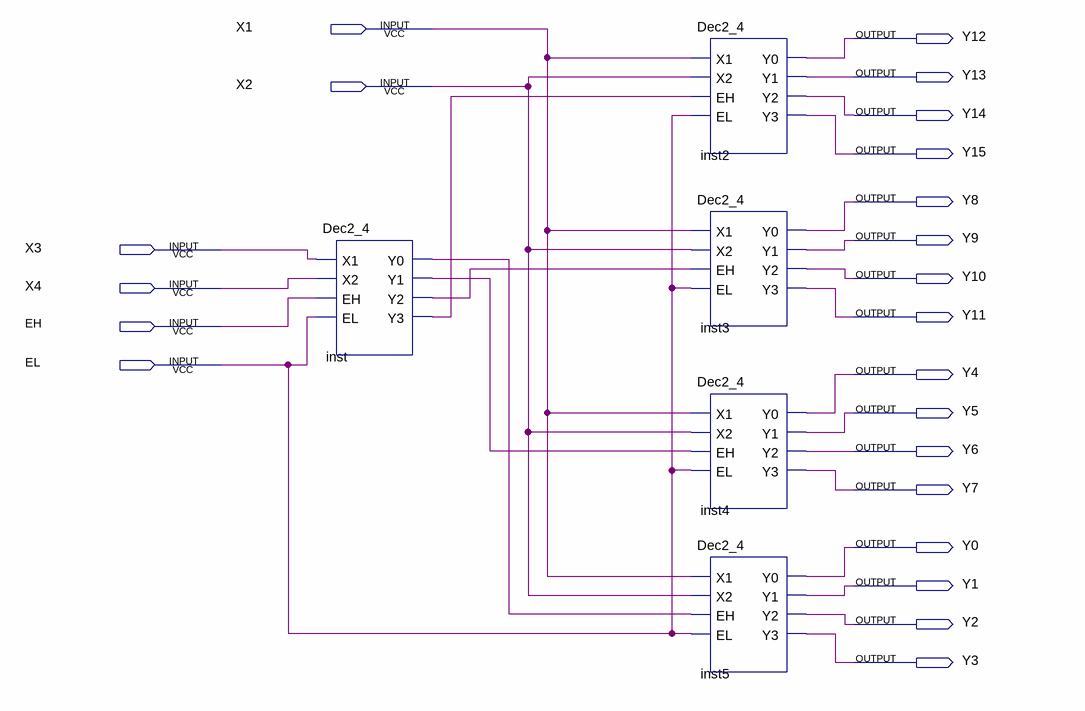
[diagram p0: schematic sheet]
// Quartus schematic Dec4_16.bdf as structural Verilog: 5 symbols, 22 pins
module Dec4_16 (
  input  X1,
  input  X2,
  input  X3,
  input  X4,
  input  EH,
  input  EL,
  output Y12,
  output Y13,
  output Y14,
  output Y15,
  output Y8,
  output Y9,
  output Y10,
  output Y11,
  output Y4,
  output Y5,
  output Y6,
  output Y7,
  output Y0,
  output Y1,
  output Y2,
  output Y3
);

  wire inst_y0, inst_y1, inst_y2, inst_y3;

  Dec2_4 inst (.X1(X3), .X2(X4), .EH(EH), .EL(EL), .Y0(inst_y0), .Y1(inst_y1), .Y2(inst_y2), .Y3(inst_y3));
  Dec2_4 inst2 (.X1(X1), .X2(X2), .EH(inst_y3), .EL(EL), .Y0(Y12), .Y1(Y13), .Y2(Y14), .Y3(Y15));
  Dec2_4 inst3 (.X1(X1), .X2(X2), .EH(inst_y2), .EL(EL), .Y0(Y8), .Y1(Y9), .Y2(Y10), .Y3(Y11));
  Dec2_4 inst4 (.X1(X1), .X2(X2), .EH(inst_y1), .EL(EL), .Y0(Y4), .Y1(Y5), .Y2(Y6), .Y3(Y7));
  Dec2_4 inst5 (.X1(X1), .X2(X2), .EH(inst_y0), .EL(EL), .Y0(Y0), .Y1(Y1), .Y2(Y2), .Y3(Y3));
endmodule
